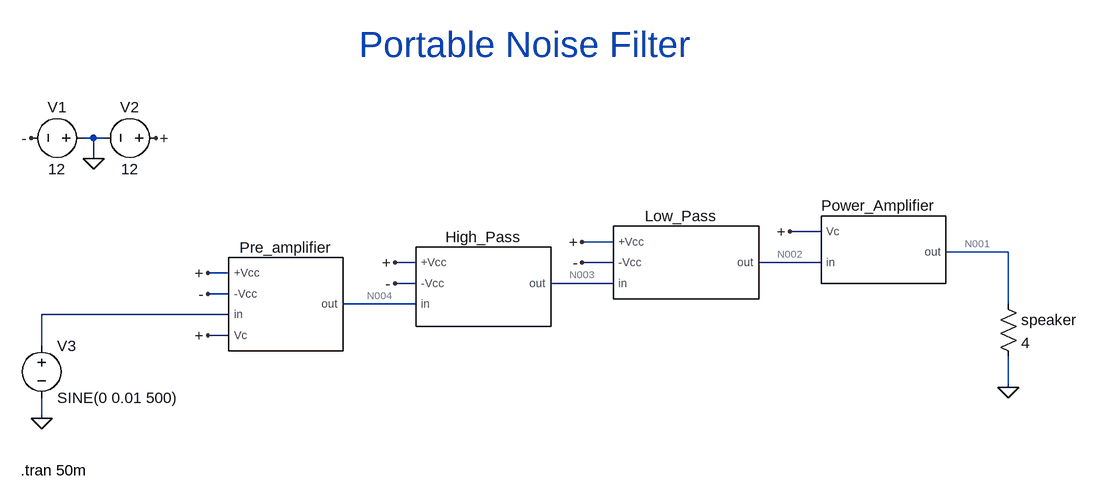
[diagram p0: schematic final.asc]
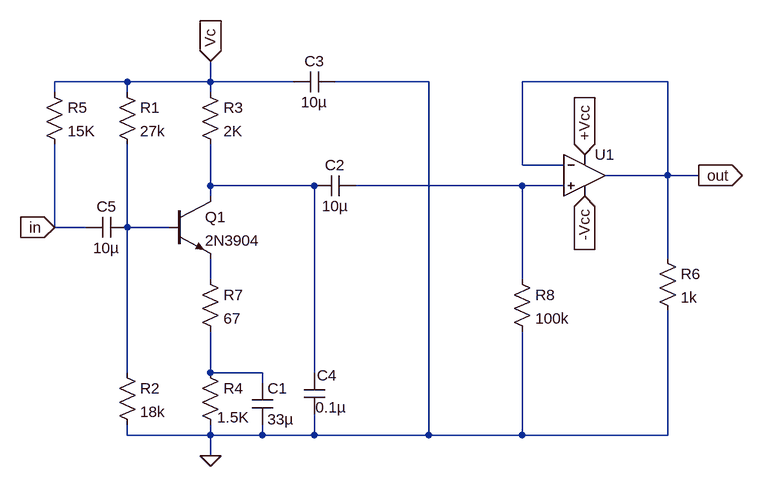
[diagram p1: sub-circuit pre_amplifier.asc]
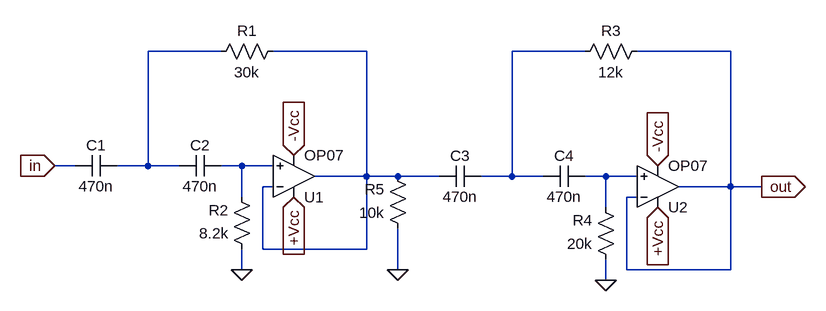
[diagram p2: sub-circuit high_pass_updated.asc]
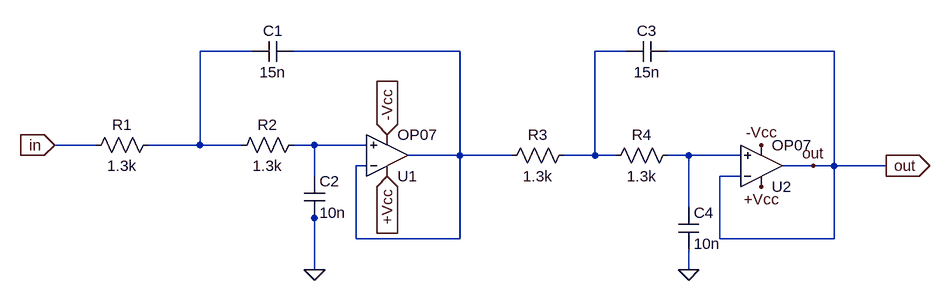
[diagram p3: sub-circuit low_pass_updated.asc]
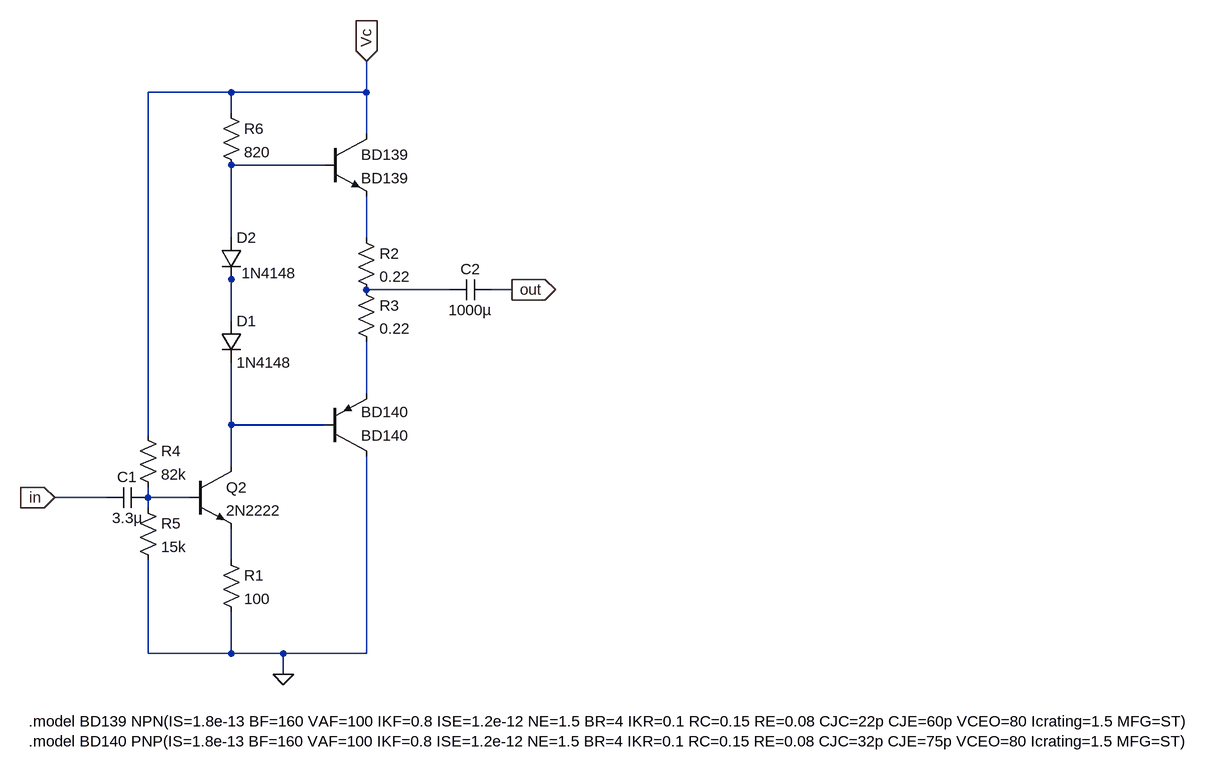
[diagram p4: sub-circuit power_amplifier.asc]
final.asc, the LTspice schematic file:
Version 4.1
SHEET 1 1292 680
WIRE -336 -96 -352 -96
WIRE -320 -96 -336 -96
WIRE -336 -64 -336 -96
WIRE 784 48 736 48
WIRE 464 64 416 64
WIRE 1072 80 976 80
WIRE 160 96 128 96
WIRE 464 96 416 96
WIRE 784 96 688 96
WIRE -128 112 -160 112
WIRE 160 128 128 128
WIRE 464 128 368 128
WIRE -128 144 -160 144
WIRE 160 160 48 160
WIRE 1072 160 1072 80
WIRE -128 176 -416 176
WIRE -128 208 -160 208
WIRE -416 224 -416 176
WIRE 1072 288 1072 240
WIRE -416 336 -416 304
FLAG -336 -64 0
FLAG -240 -96 +
FLAG -160 112 +
FLAG 128 96 +
FLAG 416 64 +
FLAG -432 -96 -
FLAG -160 144 -
FLAG 128 128 -
FLAG 416 96 -
FLAG -160 208 +
FLAG -416 336 0
FLAG 1072 288 0
FLAG 736 48 +
SYMBOL Pre_Amplifier -48 160 R0
SYMATTR InstName Pre_amplifier
SYMBOL High_Pass_updated 256 128 R0
SYMATTR InstName High_Pass
SYMBOL Low_Pass_updated 560 96 R0
SYMATTR InstName Low_Pass
SYMBOL voltage -336 -96 R90
WINDOW 0 -32 56 VBottom 2
WINDOW 3 32 56 VTop 2
WINDOW 123 0 0 Left 0
WINDOW 39 0 0 Left 0
SYMATTR InstName V1
SYMATTR Value 12
SYMBOL voltage -224 -96 R90
WINDOW 0 -32 56 VBottom 2
WINDOW 3 32 56 VTop 2
WINDOW 123 0 0 Left 0
WINDOW 39 0 0 Left 0
SYMATTR InstName V2
SYMATTR Value 12
SYMBOL voltage -416 208 R0
WINDOW 123 0 0 Left 0
WINDOW 39 0 0 Left 0
SYMATTR InstName V3
SYMATTR Value SINE(0 0.01 500)
SYMBOL res 1056 144 R0
SYMATTR InstName speaker
SYMATTR Value 4
SYMBOL Power_Amplifier 864 64 R0
WINDOW 0 8 -40 Bottom 2
SYMATTR InstName Power_Amplifier
TEXT -448 416 Left 2 !.tran 50m
TEXT 328 -240 Center 5 ;Portable Noise Filter

pre_amplifier.asc, the sub-circuit schematic file:
Version 4.1
SHEET 1 1172 680
WIRE 160 -80 48 -80
WIRE 288 -80 288 -112
WIRE 288 -80 160 -80
WIRE 416 -80 288 -80
WIRE 624 -80 480 -80
WIRE 992 -80 768 -80
WIRE 48 -64 48 -80
WIRE 160 -64 160 -80
WIRE 288 -64 288 -80
WIRE 768 48 768 -80
WIRE 832 48 768 48
WIRE 992 64 992 -80
WIRE 992 64 896 64
WIRE 1040 64 992 64
WIRE 288 80 288 16
WIRE 448 80 288 80
WIRE 768 80 512 80
WIRE 832 80 768 80
WIRE 288 96 288 80
WIRE 48 144 48 16
WIRE 96 144 48 144
WIRE 160 144 160 16
WIRE 160 144 144 144
WIRE 224 144 160 144
WIRE 992 192 992 64
WIRE 288 224 288 192
WIRE 768 224 768 80
WIRE 160 368 160 144
WIRE 288 368 288 304
WIRE 368 368 288 368
WIRE 448 368 448 80
WIRE 368 384 368 368
WIRE 160 464 160 448
WIRE 288 464 288 448
WIRE 288 464 160 464
WIRE 368 464 368 448
WIRE 368 464 288 464
WIRE 448 464 448 432
WIRE 448 464 368 464
WIRE 624 464 624 -80
WIRE 624 464 448 464
WIRE 768 464 768 304
WIRE 768 464 624 464
WIRE 992 464 992 272
WIRE 992 464 768 464
WIRE 288 496 288 464
FLAG 288 496 0
FLAG 864 32 +Vcc
IOPIN 864 32 In
FLAG 864 96 -Vcc
IOPIN 864 96 In
FLAG 288 -112 Vc
IOPIN 288 -112 In
FLAG 48 144 in
IOPIN 48 144 In
FLAG 1040 64 out
IOPIN 1040 64 Out
SYMBOL res 144 -80 R0
SYMATTR InstName R1
SYMATTR Value 27k
SYMBOL res 144 352 R0
SYMATTR InstName R2
SYMATTR Value 18k
SYMBOL res 272 -80 R0
SYMATTR InstName R3
SYMATTR Value 2K
SYMATTR SpiceLine tol=1 pwr=0.1
SYMBOL res 272 352 R0
WINDOW 3 26 85 Left 2
SYMATTR Value 1.5K
SYMATTR InstName R4
SYMATTR SpiceLine tol=1 pwr=0.1
SYMBOL res 32 -80 R0
SYMATTR InstName R5
SYMATTR Value 15K
SYMATTR SpiceLine tol=1 pwr=0.1
SYMBOL npn 224 96 R0
SYMATTR InstName Q1
SYMATTR Value 2N3904
SYMBOL cap 352 384 R0
SYMATTR InstName C1
SYMATTR Value 33µ
SYMATTR SpiceLine V=2.5 Irms=790m Rser=0.18 Lser=0 mfg="Vishay" pn="T55A336M2R5" type="Tantalum Polymer"
SYMBOL cap 512 64 R90
WINDOW 0 0 32 VBottom 2
WINDOW 3 32 32 VTop 2
SYMATTR InstName C2
SYMATTR Value 10µ
SYMATTR SpiceLine V=2.5 Irms=0 Rser=0 Lser=0 mfg="Murata" pn="GRM155R60E106ME16" type="X5R"
SYMBOL cap 416 -64 R270
WINDOW 0 32 32 VTop 2
WINDOW 3 0 32 VBottom 2
SYMATTR InstName C3
SYMATTR Value 10µ
SYMATTR SpiceLine V=2.5 Irms=0 Rser=0 Lser=0 mfg="Murata" pn="GRM155R60E106ME16" type="X5R"
SYMBOL cap 464 432 R180
WINDOW 0 -19 60 Left 2
WINDOW 3 -33 11 Left 2
SYMATTR InstName C4
SYMATTR Value 0.1µ
SYMATTR SpiceLine V=4 Irms=0 Rser=0 Lser=0 mfg="Murata" pn="GRM011R60G103KE01" type="X5R"
SYMBOL cap 160 128 R90
WINDOW 0 0 32 VBottom 2
WINDOW 3 32 32 VTop 2
SYMATTR InstName C5
SYMATTR Value 10µ
SYMATTR SpiceLine V=2.5 Irms=0 Rser=0 Lser=0 mfg="Murata" pn="GRM155R60E106ME16" type="X5R"
SYMBOL res 272 208 R0
SYMATTR InstName R7
SYMATTR Value 67
SYMBOL OpAmps\\UniversalOpAmp 864 64 R0
SYMATTR InstName U1
SYMBOL res 976 176 R0
SYMATTR InstName R6
SYMATTR Value 1k
SYMBOL res 752 208 R0
SYMATTR InstName R8
SYMATTR Value 100k

high_pass_updated.asc, the sub-circuit schematic file:
Version 4.1
SHEET 1 1492 680
WIRE -352 32 -464 32
WIRE -128 32 -272 32
WIRE 208 32 96 32
WIRE 432 32 288 32
WIRE -576 208 -608 208
WIRE -464 208 -464 32
WIRE -464 208 -512 208
WIRE -416 208 -464 208
WIRE -320 208 -352 208
WIRE -272 208 -320 208
WIRE -128 224 -128 32
WIRE -128 224 -208 224
WIRE -80 224 -128 224
WIRE -16 224 -80 224
WIRE 96 224 96 32
WIRE 96 224 48 224
WIRE 144 224 96 224
WIRE 240 224 208 224
WIRE 288 224 240 224
WIRE -272 240 -288 240
WIRE 432 240 432 32
WIRE 432 240 352 240
WIRE 480 240 432 240
WIRE -320 256 -320 208
WIRE 288 256 272 256
WIRE 240 272 240 224
WIRE -288 336 -288 240
WIRE -128 336 -128 224
WIRE -128 336 -288 336
WIRE -320 368 -320 336
WIRE -80 368 -80 304
WIRE 272 368 272 256
WIRE 432 368 432 240
WIRE 432 368 272 368
WIRE 240 384 240 352
FLAG -240 256 +Vcc
IOPIN -240 256 In
FLAG -240 192 -Vcc
IOPIN -240 192 In
FLAG -320 368 0
FLAG -80 368 0
FLAG 320 272 +Vcc
IOPIN 320 272 In
FLAG 320 208 -Vcc
IOPIN 320 208 In
FLAG 240 384 0
FLAG -608 208 in
IOPIN -608 208 In
FLAG 480 240 out
IOPIN 480 240 Out
SYMBOL cap -512 192 R90
WINDOW 0 0 32 VBottom 2
WINDOW 3 32 32 VTop 2
SYMATTR InstName C1
SYMATTR Value 470n
SYMBOL cap -352 192 R90
WINDOW 0 0 32 VBottom 2
WINDOW 3 32 32 VTop 2
SYMATTR InstName C2
SYMATTR Value 470n
SYMBOL res -256 16 R90
WINDOW 0 0 56 VBottom 2
WINDOW 3 32 56 VTop 2
SYMATTR InstName R1
SYMATTR Value 30k
SYMBOL res -304 352 R180
WINDOW 0 36 76 Left 2
WINDOW 3 36 40 Left 2
SYMATTR InstName R2
SYMATTR Value 8.2k
SYMBOL OpAmps\\OP07 -240 288 M180
SYMATTR InstName U1
SYMBOL res -64 320 R180
WINDOW 0 36 76 Left 2
WINDOW 3 36 40 Left 2
SYMATTR InstName R5
SYMATTR Value 10k
SYMBOL cap 48 208 R90
WINDOW 0 0 32 VBottom 2
WINDOW 3 32 32 VTop 2
SYMATTR InstName C3
SYMATTR Value 470n
SYMBOL cap 208 208 R90
WINDOW 0 0 32 VBottom 2
WINDOW 3 32 32 VTop 2
SYMATTR InstName C4
SYMATTR Value 470n
SYMBOL res 304 16 R90
WINDOW 0 0 56 VBottom 2
WINDOW 3 32 56 VTop 2
SYMATTR InstName R3
SYMATTR Value 12k
SYMBOL res 256 368 R180
WINDOW 0 36 76 Left 2
WINDOW 3 36 40 Left 2
SYMATTR InstName R4
SYMATTR Value 20k
SYMBOL OpAmps\\OP07 320 304 M180
SYMATTR InstName U2

low_pass_updated.asc, the sub-circuit schematic file:
Version 4.1
SHEET 1 1668 680
WIRE 48 -880 -32 -880
WIRE 368 -880 112 -880
WIRE 624 -880 576 -880
WIRE 944 -880 688 -880
WIRE -192 -736 -256 -736
WIRE -32 -736 -32 -880
WIRE -32 -736 -112 -736
WIRE 32 -736 -32 -736
WIRE 144 -736 112 -736
WIRE 224 -736 144 -736
WIRE 368 -720 368 -880
WIRE 368 -720 288 -720
WIRE 448 -720 368 -720
WIRE 576 -720 576 -880
WIRE 576 -720 528 -720
WIRE 608 -720 576 -720
WIRE 720 -720 688 -720
WIRE 800 -720 720 -720
WIRE 224 -704 208 -704
WIRE 912 -704 864 -704
WIRE 944 -704 944 -880
WIRE 944 -704 912 -704
WIRE 1024 -704 944 -704
WIRE 144 -688 144 -736
WIRE 800 -688 768 -688
WIRE 720 -640 720 -720
WIRE 144 -624 144 -640
WIRE 208 -592 208 -704
WIRE 368 -592 368 -720
WIRE 368 -592 208 -592
WIRE 768 -592 768 -688
WIRE 944 -592 944 -704
WIRE 944 -592 768 -592
WIRE 144 -544 144 -624
WIRE 720 -544 720 -576
FLAG 144 -544 0
FLAG 720 -544 0
FLAG 912 -704 out
FLAG 256 -688 +Vcc
IOPIN 256 -688 In
FLAG 832 -672 +Vcc
FLAG 256 -752 -Vcc
IOPIN 256 -752 In
FLAG 832 -736 -Vcc
FLAG -256 -736 in
IOPIN -256 -736 In
FLAG 1024 -704 out
IOPIN 1024 -704 Out
SYMBOL cap 112 -896 R90
WINDOW 0 0 32 VBottom 2
WINDOW 3 32 32 VTop 2
SYMATTR InstName C1
SYMATTR Value 15n
SYMBOL cap 128 -688 R0
SYMATTR InstName C2
SYMATTR Value 10n
SYMBOL res -96 -752 R90
WINDOW 0 0 56 VBottom 2
WINDOW 3 32 56 VTop 2
SYMATTR InstName R1
SYMATTR Value 1.3k
SYMBOL res 128 -752 R90
WINDOW 0 0 56 VBottom 2
WINDOW 3 32 56 VTop 2
SYMATTR InstName R2
SYMATTR Value 1.3k
SYMBOL OpAmps\\OP07 256 -656 M180
SYMATTR InstName U1
SYMBOL cap 688 -896 R90
WINDOW 0 0 32 VBottom 2
WINDOW 3 32 32 VTop 2
SYMATTR InstName C3
SYMATTR Value 15n
SYMBOL cap 704 -640 R0
SYMATTR InstName C4
SYMATTR Value 10n
SYMBOL res 544 -736 R90
WINDOW 0 0 56 VBottom 2
WINDOW 3 32 56 VTop 2
SYMATTR InstName R3
SYMATTR Value 1.3k
SYMBOL res 704 -736 R90
WINDOW 0 0 56 VBottom 2
WINDOW 3 32 56 VTop 2
SYMATTR InstName R4
SYMATTR Value 1.3k
SYMBOL OpAmps\\OP07 832 -640 M180
SYMATTR InstName U2

power_amplifier.asc, the sub-circuit schematic file:
Version 4.1
SHEET 1 2296 1064
WIRE 96 32 -32 32
WIRE 304 32 304 -16
WIRE 304 32 96 32
WIRE 96 64 96 32
WIRE 304 96 304 32
WIRE 240 144 96 144
WIRE 96 256 96 144
WIRE 304 256 304 192
WIRE 96 320 96 304
WIRE 432 336 304 336
WIRE 528 336 496 336
WIRE 96 384 96 320
WIRE 304 496 304 416
WIRE 96 544 96 448
WIRE 240 544 96 544
WIRE -32 560 -32 32
WIRE 96 608 96 544
WIRE -96 656 -176 656
WIRE -32 656 -32 640
WIRE 32 656 -32 656
WIRE -32 672 -32 656
WIRE 96 752 96 704
WIRE -32 896 -32 752
WIRE 96 896 96 832
WIRE 96 896 -32 896
WIRE 176 896 96 896
WIRE 304 896 304 592
WIRE 304 896 176 896
WIRE 176 928 176 896
FLAG 176 928 0
FLAG -176 656 in
IOPIN -176 656 In
FLAG 528 336 out
IOPIN 528 336 Out
FLAG 304 -16 Vc
IOPIN 304 -16 In
SYMBOL npn 240 96 R0
SYMATTR InstName BD139
SYMATTR Value BD139
SYMBOL npn 32 608 R0
SYMATTR InstName Q2
SYMATTR Value 2N2222
SYMBOL pnp 240 592 M180
SYMATTR InstName BD140
SYMATTR Value BD140
SYMBOL res 80 736 R0
SYMATTR InstName R1
SYMATTR Value 100
SYMBOL diode 80 384 R0
SYMATTR InstName D1
SYMATTR Value 1N4148
SYMBOL diode 80 256 R0
WINDOW 3 32 54 Left 2
SYMATTR Value 1N4148
SYMATTR InstName D2
SYMBOL res 288 240 R0
SYMATTR InstName R2
SYMATTR Value 0.22
SYMBOL res 288 320 R0
SYMATTR InstName R3
SYMATTR Value 0.22
SYMBOL res -48 544 R0
SYMATTR InstName R4
SYMATTR Value 82k
SYMBOL res -48 656 R0
SYMATTR InstName R5
SYMATTR Value 15k
SYMBOL cap -32 640 R90
WINDOW 0 0 32 VBottom 2
WINDOW 3 32 32 VTop 2
SYMATTR InstName C1
SYMATTR Value 3.3µ
SYMBOL res 80 48 R0
SYMATTR InstName R6
SYMATTR Value 820
SYMBOL cap 496 320 R90
WINDOW 0 0 32 VBottom 2
WINDOW 3 32 32 VTop 2
SYMATTR InstName C2
SYMATTR Value 1000µ
TEXT -216 1000 Left 2 !.model BD139 NPN(IS=1.8e-13 BF=160 VAF=100 IKF=0.8 ISE=1.2e-12 NE=1.5 BR=4 IKR=0.1 RC=0.15 RE=0.08 CJC=22p CJE=60p VCEO=80 Icrating=1.5 MFG=ST)\n.model BD140 PNP(IS=1.8e-13 BF=160 VAF=100 IKF=0.8 ISE=1.2e-12 NE=1.5 BR=4 IKR=0.1 RC=0.15 RE=0.08 CJC=32p CJE=75p VCEO=80 Icrating=1.5 MFG=ST)

The netlist it stands for:
* final.asc
X§Pre_amplifier + - N005 + N004 pre_amplifier
X§High_Pass + - N004 N003 high_pass_updated
X§Low_Pass + - N003 N002 low_pass_updated
V1 0 - 12
V2 + 0 12
V3 N005 0 SINE(0 0.01 500)
R§speaker N001 0 4
X§Power_Amplifier N002 + N001 power_amplifier

* block symbol definitions
.subckt pre_amplifier +Vcc -Vcc in Vc out
R1 Vc N003 27k
R2 N003 0 18k
R3 Vc N001 2K tol=1 pwr=0.1
R4 N005 0 1.5K tol=1 pwr=0.1
R5 Vc in 15K tol=1 pwr=0.1
Q1 N001 N003 N004 0 2N3904
C1 N005 0 33µ V=2.5 Irms=790m Rser=0.18 Lser=0 mfg="Vishay" pn="T55A336M2R5" type="Tantalum Polymer"
C2 N002 N001 10µ V=2.5 Irms=0 Rser=0 Lser=0 mfg="Murata" pn="GRM155R60E106ME16" type="X5R"
C3 Vc 0 10µ V=2.5 Irms=0 Rser=0 Lser=0 mfg="Murata" pn="GRM155R60E106ME16" type="X5R"
C4 0 N001 0.1µ V=4 Irms=0 Rser=0 Lser=0 mfg="Murata" pn="GRM011R60G103KE01" type="X5R"
C5 N003 in 10µ V=2.5 Irms=0 Rser=0 Lser=0 mfg="Murata" pn="GRM155R60E106ME16" type="X5R"
R7 N004 N005 67
X§U1 N002 out +Vcc -Vcc out level1 Avol=1Meg GBW=10Meg Vos=0 En=0 Enk=0 In=0 Ink=0 Rin=500Meg  ; pins In+ In- V+ V- OUT
R6 out 0 1k
R8 N002 0 100k
.ends pre_amplifier

.subckt high_pass_updated +Vcc -Vcc in out
C1 N001 in 470n
C2 N004 N001 470n
R1 N002 N001 30k
R2 0 N004 8.2k
X§U1 N004 N002 +Vcc -Vcc N002 LT1001  ; OP07, pins In+ In- V+ V- OUT
R5 0 N002 10k
C3 N003 N002 470n
C4 N005 N003 470n
R3 out N003 12k
R4 0 N005 20k
X§U2 N005 out +Vcc -Vcc out LT1001  ; OP07, pins In+ In- V+ V- OUT
.ends high_pass_updated

.subckt low_pass_updated +Vcc -Vcc in out
C1 N002 N001 15n
C2 N004 0 10n
R1 N001 in 1.3k
R2 N004 N001 1.3k
X§U1 N004 N002 +Vcc -Vcc N002 LT1001  ; OP07, pins In+ In- V+ V- OUT
C3 out N003 15n
C4 N005 0 10n
R3 N003 N002 1.3k
R4 N005 N003 1.3k
X§U2 N005 out +Vcc -Vcc out LT1001  ; OP07, pins In+ In- V+ V- OUT
.ends low_pass_updated

.subckt power_amplifier in Vc out
Q§BD139 Vc N001 N002 0 BD139
Q2 N006 N007 N008 0 2N2222
Q§BD140 0 N006 N005 0 BD140
R1 N008 0 100
D1 N003 N006 1N4148
D2 N001 N003 1N4148
R2 N002 N004 0.22
R3 N004 N005 0.22
R4 Vc N007 82k
R5 N007 0 15k
C1 N007 in 3.3µ
R6 Vc N001 820
C2 out N004 1000µ
.model BD139 NPN(IS=1.8e-13 BF=160 VAF=100 IKF=0.8 ISE=1.2e-12 NE=1.5 BR=4 IKR=0.1 RC=0.15 RE=0.08 CJC=22p CJE=60p VCEO=80 Icrating=1.5 MFG=ST)
.model BD140 PNP(IS=1.8e-13 BF=160 VAF=100 IKF=0.8 ISE=1.2e-12 NE=1.5 BR=4 IKR=0.1 RC=0.15 RE=0.08 CJC=32p CJE=75p VCEO=80 Icrating=1.5 MFG=ST)
.ends power_amplifier

.model D D
.lib standard.dio
.model NPN NPN
.model PNP PNP
.lib standard.bjt
.tran 50m
* Portable Noise Filter
.lib UniversalOpAmp1.lib
.lib LTC.lib
.backanno
.end

* Results of the author's LTspice run, read from the files saved beside the schematic
* Operating Point, zero values left out:
*   V(+) = 12 V
*   V(-) = -12 V
*   I(V1) = -9 mA
*   I(V2) = -48.28 mA
*   I(V3) = 800 µA
*   Ix(high_pass:+vcc) = 4.5 mA
*   Ix(high_pass:-vcc) = -4.5 mA
*   Ix(low_pass:+vcc) = 4.5 mA
*   Ix(low_pass:-vcc) = -4.5 mA
*   Ix(power_amplifier:vc) = 35.65 mA
*   Ix(pre_amplifier:+vcc) = 24 nA
*   Ix(pre_amplifier:-vcc) = -24 nA
*   Ix(pre_amplifier:in) = -800 µA
*   Ix(pre_amplifier:out) = 68.73 pA
*   Ix(pre_amplifier:vc) = 3.633 mA
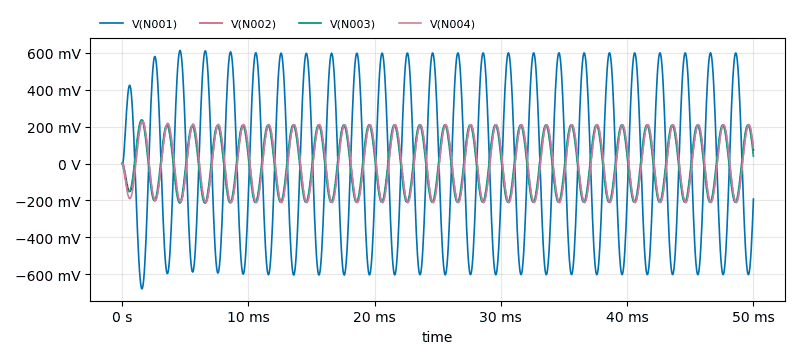
[diagram p5: Transient Analysis of final.asc, plotted from the saved traces]
* Transient Analysis, 1 run:
*   V(N001): min -678.8 mV, max 613.9 mV, average -3.734 mV, rms 428.2 mV, last -192.4 mV
*   V(N002): min -213 mV, max 235.9 mV, average 1.245 mV, rms 147.3 mV, last 73.19 mV
*   V(N003): min -213.2 mV, max 236.1 mV, average 1.306 mV, rms 147.6 mV, last 40.19 mV
*   V(N004): min -211.9 mV, max 228.3 mV, average 1.173 mV, rms 149.6 mV, last 87.01 mV